# Altium schematic sheet RF_LANES.SchDoc
size A3
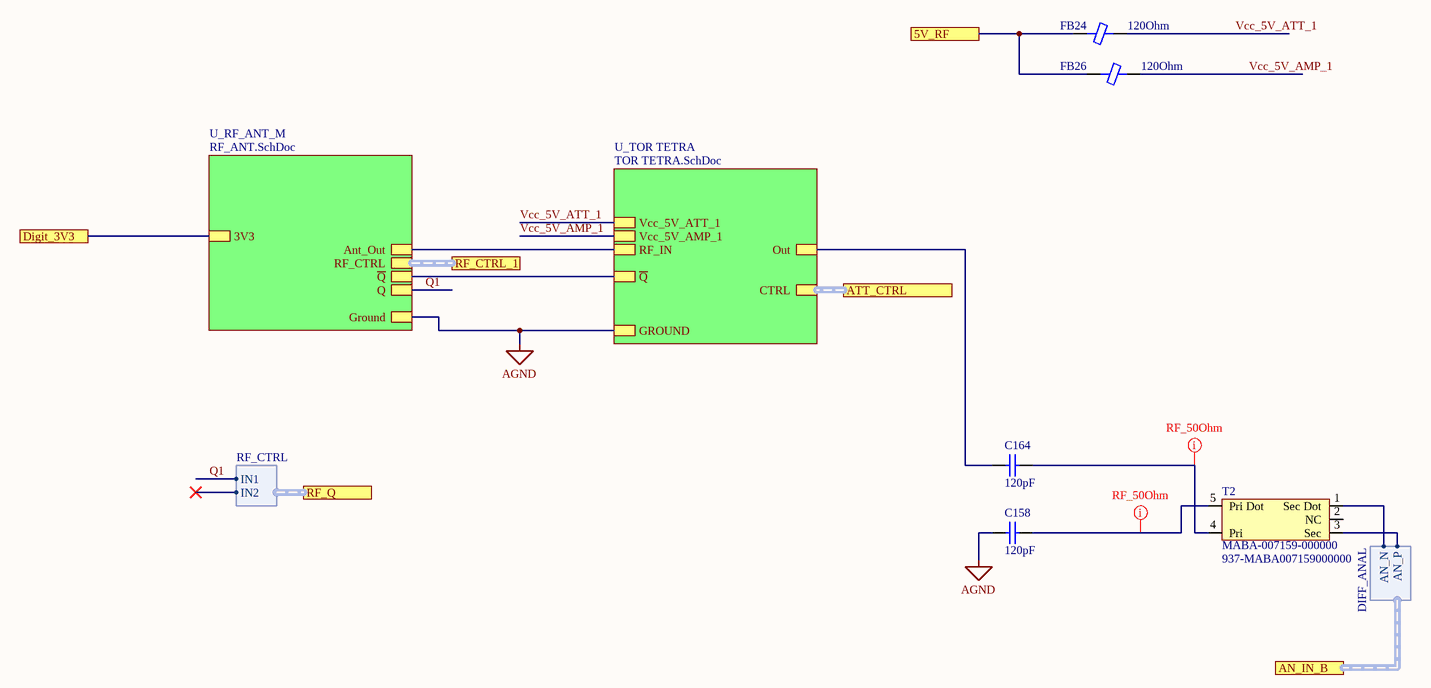
[diagram p0: RF_LANES.SchDoc]

## Parts
C158  120pF  [CAP 0402/1005 RF KK]
C164  120pF  [CAP 0402/1005 RF KK]
FB24  120Ohm  [FER 0402/1005]
FB26  120Ohm  [FER 0402/1005]
T2  MABA-007159-000000  Supplier Part Number 1: 937-MABA007159000000  [MABA-007159-000000]

## Sub-sheets
U_RF_ANT_M = RF_ANT.SchDoc: Ground, Ant_Out, ~{Q}, 3V3, Q, RF_CTRL (harness RF_CTRL)
U_TOR TETRA = TOR TETRA.SchDoc: Vcc_5V_ATT_1, Vcc_5V_AMP_1, GROUND, RF_IN, Out, CTRL (harness ATT_CTRL), ~{Q}

## Ports
5V_RF, AN_IN_B (harness DIFF_ANAL), ATT_CTRL (harness ATT_CTRL), Digit_3V3, RF_CTRL_1, RF_Q (harness RF_CTRL)

## Harnesses
DIFF_ANAL: AN_P, AN_N
RF_CTRL: IN1, IN2

## Nets
AGND: C158.1 ; sheet U_TOR TETRA/GROUND, sheet U_RF_ANT_M/Ground
5V_RF: FB24.1 FB26.1 ; port 5V_RF
Digit_3V3: port Digit_3V3, sheet U_RF_ANT_M/3V3
Q1: sheet U_RF_ANT_M/Q, port RF_Q.IN1
Vcc_5V_AMP_1: FB26.2 ; sheet U_TOR TETRA/Vcc_5V_AMP_1
Vcc_5V_ATT_1: FB24.2 ; sheet U_TOR TETRA/Vcc_5V_ATT_1
NetC158_2: C158.2 T2.5(Pri_Dot)
NetC164_1: C164.1 ; sheet U_TOR TETRA/Out
NetC164_2: C164.2 T2.4(Pri)
NetT2_1: T2.1(Sec_Dot) ; port AN_IN_B.AN_N
NetT2_3: T2.3(Sec) ; port AN_IN_B.AN_P
(unnamed): sheet U_TOR TETRA/RF_IN, sheet U_RF_ANT_M/Ant_Out
(unnamed): sheet U_TOR TETRA/~{Q}, sheet U_RF_ANT_M/~{Q}

Not connected (* = marked no-connect by the designer): T2 2(NC)

## Buses and harness runs
harness port ATT_CTRL = sheet U_TOR TETRA/CTRL
harness port RF_CTRL_1 = sheet U_RF_ANT_M/RF_CTRL

## Layout directives
net class Single50: NetC158_2, NetC164_2

## Notes on the sheet
- Title
- Size:
- Date:
- A3
- Number:
- Time:
- Revision:
- Sheet
- of
- File:

## Library data of the parts
C158 C164 = Capacitor: CAP CER 120PF 25V C0G/NP0 0402; Manufacturer: KEMET; Manufacturer Part Number: C0402C121J3GAC7867; Tolerance: 5%; Supplier 1: Digi-Key; Supplier Part Number 1: 399-14880-1-ND; RoHS: No; Category: Ceramic Capacitors; Stock 1: 43311; Pricing 1: 1=0,10000, 10=0,04100, 50=0,02260, 100=0,01840, 500=0,01312, 1000=0,01032, 2500=0,00938, 5000=0,00863 (USD); Mount: Surface Mount; Case/Package: 0402; Case Code (Imperial): 0402; Case Code (Metric): 1005; Min Operating Temperature: -55°C; Max Operating Temperature: 125°C; Packaging: Tape and Reel; Capacitance: 120pF; Voltage Rating: 25V; ComponentLink1URL: https://api.kemet.com/component-edge/download/datasheet/C0402C121J3GAC7867.pdf?src-supplier=Digi-Key; ComponentLink1Description: https://api.kemet.com/component-edge/download/datasheet/C0402C121J3GAC7867.pdf?src-supplier=Digi-Key
FB24 FB26 = Ferrite Chip: SMT Ferrite Chip; Value: 120Ohm; Supplier 1: Digi-Key; Supplier Part Number 1: 490-1008-1-ND
T2 = MABA-007159-000000: Manufacturer: TE Connectivity MA-COM; Turns Ratio: 1:1; Power Rating: 250mW; Max DC Current: 30mA; Lead/Base Style: Gull Wing; Supplier 1: Mouser; Manufacturer Part Number: MABA-007159-000000; Stock 1: 6455; Pricing 1: 1 = 1,75000, 10 = 1,41000, 50 = 1,41000, 100 = 1,13000, 1000 = 0,88000, 10000 = 0,68800 (USD); RoHS: Yes; Mount: Surface Mount; Case/Package: SMD/SMT; Number of Pins: 5; Min Operating Temperature: -40°C; Max Operating Temperature: 85°C; Packaging: Tape and Reel; Package Quantity: 2000; Termination: SMD/SMT; Length: 3.81mm; Height: 2.67mm; Width: 3.81mm; Depth: 3.81mm; Radiation Hardening: No; Lead Free: Lead Free; ComponentLink1URL: https://datasheet.ciiva.com/3295/maba-007159-000000-3295941.pdf?src-supplier=Avnet; ComponentLink1Description: https://datasheet.ciiva.com/3295/maba-007159-000000-3295941.pdf?src-supplier=Avnet; ComponentLink2URL: https://datasheet.ciiva.com/4550/maba-007159-000000-13414-4550885.pdf?src-supplier=Mouser; ComponentLink2Description: https://datasheet.ciiva.com/4550/maba-007159-000000-13414-4550885.pdf?src-supplier=Mouser; ComponentLink3URL: https://datasheet.ciiva.com/29655/maba-007159-000000-29655720.pdf?src-supplier=Digi-Key; ComponentLink3Description: https://datasheet.ciiva.com/29655/maba-007159-000000-29655720.pdf?src-supplier=Digi-Key; ComponentLink4URL: https://datasheet.ciiva.com/29655/maba-007159-000000-29655722.pdf?src-supplier=Digi-Key; ComponentLink4Description: https://datasheet.ciiva.com/29655/maba-007159-000000-29655722.pdf?src-supplier=Digi-Key